# Altium project DC-Motor-Driver-v2.0.PrjPcb (part 2 of 3)

## Sheet Controller_Fuses_Sheet.SchDoc
size 420 x 297 mm; SheetNumber: 5; SheetTotal: 5
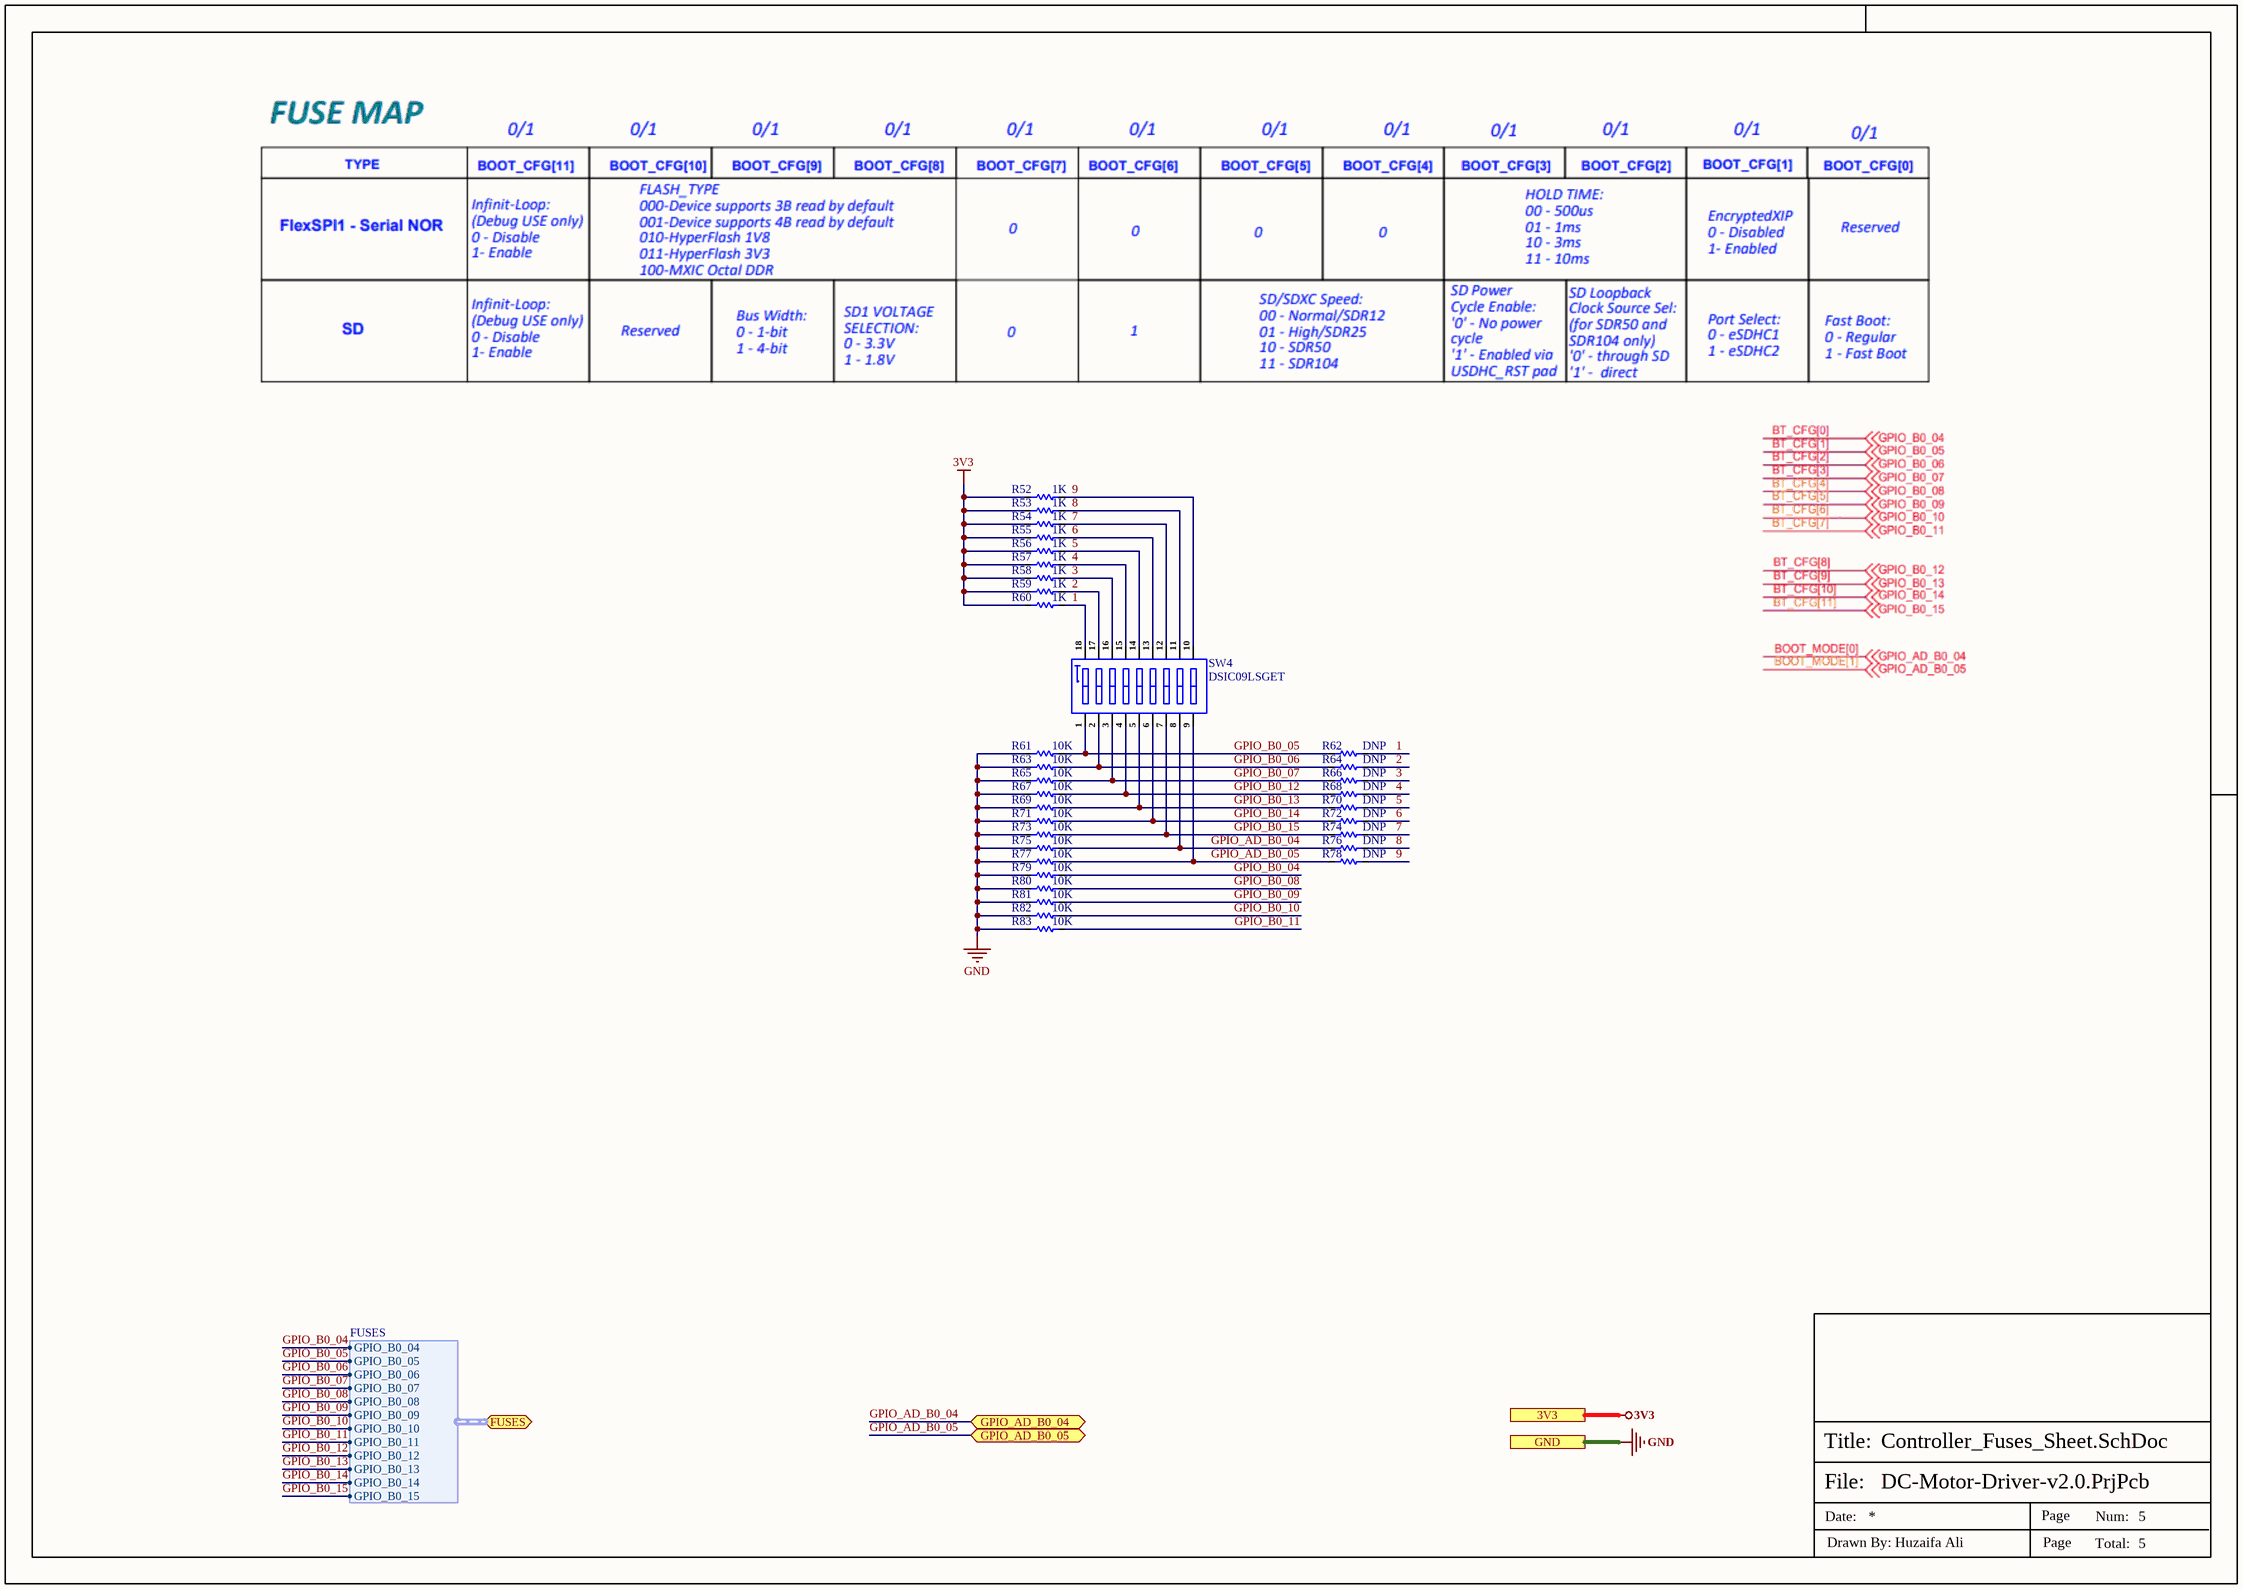
[diagram p2: Controller_Fuses_Sheet.SchDoc]

### Parts
R52  1K  [Res-0603]
R53  1K  [Res-0603]
R54  1K  [Res-0603]
R55  1K  [Res-0603]
R56  1K  [Res-0603]
R57  1K  [Res-0603]
R58  1K  [Res-0603]
R59  1K  [Res-0603]
R60  1K  [Res-0603]
R61  10K  [Res-0402]
R62  DNP  [Res-0402]
R63  10K  [Res-0402]
R64  DNP  [Res-0402]
R65  10K  [Res-0402]
R66  DNP  [Res-0402]
R67  10K  [Res-0402]
R68  DNP  [Res-0402]
R69  10K  [Res-0402]
R70  DNP  [Res-0402]
R71  10K  [Res-0402]
R72  DNP  [Res-0402]
R73  10K  [Res-0402]
R74  DNP  [Res-0402]
R75  10K  [Res-0402]
R76  DNP  [Res-0402]
R77  10K  [Res-0402]
R78  DNP  [Res-0402]
R79  10K  [Res-0402]
R80  10K  [Res-0402]
R81  10K  [Res-0402]
R82  10K  [Res-0402]
R83  10K  [Res-0402]
SW4  DSIC09LSGET  [DSIC09LSGET]

### Ports
3V3, FUSES (bidir, harness FUSES), GND, GPIO_AD_B0_04 (bidir), GPIO_AD_B0_05 (bidir)

### Harnesses
FUSES: GPIO_B0_04, GPIO_B0_05, GPIO_B0_06, GPIO_B0_07, GPIO_B0_08, GPIO_B0_09, GPIO_B0_10, GPIO_B0_11, GPIO_B0_12, GPIO_B0_13, GPIO_B0_14, GPIO_B0_15

### Nets
3V3: R52.2 R53.2 R54.2 R55.2 R56.2 R57.2 R58.2 R59.2 R60.2 ; port 3V3
GND: R61.1 R63.1 R65.1 R67.1 R69.1 R71.1 R73.1 R75.1 R77.1 R79.1 R80.1 R81.1 R82.1 R83.1 ; port GND
1: R60.1 R62.2 SW4.18(B1)
2: R59.1 R64.2 SW4.17(B2)
3: R58.1 R66.2 SW4.16(B3)
4: R57.1 R68.2 SW4.15(B4)
5: R56.1 R70.2 SW4.14(B5)
6: R55.1 R72.2 SW4.13(B6)
7: R54.1 R74.2 SW4.12(B7)
8: R53.1 R76.2 SW4.11(B8)
9: R52.1 R78.2 SW4.10(B9)
GPIO_AD_B0_04: R75.2 R76.1 SW4.8(A8) ; port GPIO_AD_B0_04
GPIO_AD_B0_05: R77.2 R78.1 SW4.9(A9) ; port GPIO_AD_B0_05
GPIO_B0_04: R79.2 ; port FUSES.GPIO_B0_04
GPIO_B0_05: R61.2 R62.1 SW4.1(A1) ; port FUSES.GPIO_B0_05
GPIO_B0_06: R63.2 R64.1 SW4.2(A2) ; port FUSES.GPIO_B0_06
GPIO_B0_07: R65.2 R66.1 SW4.3(A3) ; port FUSES.GPIO_B0_07
GPIO_B0_08: R80.2 ; port FUSES.GPIO_B0_08
GPIO_B0_09: R81.2 ; port FUSES.GPIO_B0_09
GPIO_B0_10: R82.2 ; port FUSES.GPIO_B0_10
GPIO_B0_11: R83.2 ; port FUSES.GPIO_B0_11
GPIO_B0_12: R67.2 R68.1 SW4.4(A4) ; port FUSES.GPIO_B0_12
GPIO_B0_13: R69.2 R70.1 SW4.5(A5) ; port FUSES.GPIO_B0_13
GPIO_B0_14: R71.2 R72.1 SW4.6(A6) ; port FUSES.GPIO_B0_14
GPIO_B0_15: R73.2 R74.1 SW4.7(A7) ; port FUSES.GPIO_B0_15

### Notes on the sheet
- File:
- Title:
- Date:
- Page
- Num:
- Total:
- Drawn By: Huzaifa Ali

### Library data of the parts
R52-R60 = RC0603FR-071KL: RES SMD 1K OHM 1% 1/10W 0603; Manufacturer: Yageo; Resistance: 1kR; Temperature Coefficient: 100ppm/°C; Power Rating: 100mW; Voltage Rating: 50V; Item type: Resistor; ComponentLink1URL: https://www.verical.com/server-webapp/html/getDatasheet?partID=409289&src-supplier=Verical; ComponentLink1Description: https://www.verical.com/server-webapp/html/getDatasheet?partID=409289&src-supplier=Verical; Supplier 1: Digi-Key; Manufacturer Part Number: RC0603FR-071KL; Stock 1: 21472395; Pricing 1: 1=0.1, 10=0.023, 100=0.0094, 1000=0.0042, 2500=0.0037 (USD); Case/Package: 0603; Contact Plating: Tin,Matte; Case Code (Imperial): 0603; Case Code (Metric): 1608; Min Operating Temperature: -55°C; Max Operating Temperature: 155°C; Tolerance: 1%; Composition: Thick Film; Packaging: Tape and Reel; Termination: SMD/SMT; Military Standard: Not; Length: 1.6mm; Height: 0.45mm; Depth: 0.8mm; Radiation Hardening: No; REACH SVHC: No SVHC; Lead Free: Lead Free; ComponentLink2URL: http://documents.rs-components.com/techlib://itc_doclist_GB.htm?stockno=5048928&src-supplier=RSComponents; ComponentLink2Description: http://documents.rs-components.com/techlib://itc_doclist_GB.htm?stockno=5048928&src-supplier=RSComponents; ComponentLink3URL: http://www.yageo.com/documents/recent/PYu-RC0603_51_RoHS_L_4.pdf?src-supplier=Avnet+Europe; ComponentLink3Description: http://www.yageo.com/documents/recent/PYu-RC0603_51_RoHS_L_4.pdf?src-supplier=Avnet+Europe; ComponentLink4URL: http://www.farnell.com/datasheets/2167052.pdf?src-supplier=Element14; ComponentLink4Description: http://www.farnell.com/datasheets/2167052.pdf?src-supplier=Element14; ComponentLink5URL: http://www.farnell.com/datasheets/1868787.pdf?src-supplier=Element14; ComponentLink5Description: http://www.farnell.com/datasheets/1868787.pdf?src-supplier=Element14; ComponentLink6URL: http://www.yageo.com/documents/recent/PYu-RC_Group_51_RoHS_L_2.pdf?src-supplier=Avnet; ComponentLink6Description: http://www.yageo.com/documents/recent/PYu-RC_Group_51_RoHS_L_2.pdf?src-supplier=Avnet; ComponentLink7URL: https://www.verical.com/server-webapp/html/getDatasheet?partID=404327&src-supplier=Verical; ComponentLink7Description: https://www.verical.com/server-webapp/html/getDatasheet?partID=404327&src-supplier=Verical; ComponentLink8URL: http://www.farnell.com/datasheets/443971.pdf?src-supplier=Element14; ComponentLink8Description: http://www.farnell.com/datasheets/443971.pdf?src-supplier=Element14; Supplier Part Number 1: 311-1.00KHRDKR-ND; LCSC Part Number: C22548
R61 R63 R65 R67 R69 R71 R73 R75 R77 R79-R83 = RC0402FR-0710KL: RES 10K OHM 1% 1/16W 0402; Manufacturer: Yageo; Resistance: 10kR; Voltage Rating (DC): 50V; Temperature Coefficient: 100ppm/°C; Power Rating: 62.5mW; Max Power Dissipation: 63mW; Item Type: Resistor; Supplier 1: Mouser; Manufacturer Part Number: RC0402FR-0710KL; RoHS: Yes; Category: Chip SMD Resistors; Stock 1: 18648329; Pricing 1: 1=0.10000, 10=0.01400, 50=0.01400, 100=0.00500, 1000=0.00300, 10000=0.00200 (USD); Case/Package: 0402; Number of Pins: 2; Case Code (Imperial): 0402; Case Code (Metric): 1005; Min Operating Temperature: -55°C; Max Operating Temperature: 155°C; Resistor Type: Thick Film; Tolerance: 1%; Packaging: Tape and Reel; Voltage Rating: 50V; Termination: SMD/SMT; Working Voltage: 50V; Number of Terminations: 2; Features: Moisture Resistant; Series: RC; Resistance Tolerance: 1%; Construction: Rectangular; Length: 1mm; Width: 0.5mm; Height: 0.32mm; Depth: 0.5mm; Lead Pitch: 0.2mm; REACH SVHC: No SVHC; Lead Free: Lead Free; RoHS Compliant: Yes; Military Standard: Not; ComponentLink1URL: https://datasheet.ciiva.com/7660/38568-7660787.pdf?src-supplier=Element14; ComponentLink1Description: https://datasheet.ciiva.com/7660/38568-7660787.pdf?src-supplier=Element14; ComponentLink2URL: https://datasheet.ciiva.com/7849/1686128-7849814.pdf?src-supplier=Element14; ComponentLink2Description: https://datasheet.ciiva.com/7849/1686128-7849814.pdf?src-supplier=Element14; ComponentLink3URL: https://datasheet.ciiva.com/7983/1018594-7983486.pdf?src-supplier=Element14; ComponentLink3Description: https://datasheet.ciiva.com/7983/1018594-7983486.pdf?src-supplier=Element14; ComponentLink4URL: https://datasheet.ciiva.com/22747/1018594-22747512.pdf?src-supplier=Element14; ComponentLink4Description: https://datasheet.ciiva.com/22747/1018594-22747512.pdf?src-supplier=Element14; ComponentLink5URL: https://datasheet.ciiva.com/12667/pyu-rc0402-51-rohs-l-6-r-12667067.pdf?src-supplier=Mouser; ComponentLink5Description: https://datasheet.ciiva.com/12667/pyu-rc0402-51-rohs-l-6-r-12667067.pdf?src-supplier=Mouser; ComponentLink6URL: https://datasheet.ciiva.com/7849/1784430-7849813.pdf?src-supplier=Element14; ComponentLink6Description: https://datasheet.ciiva.com/7849/1784430-7849813.pdf?src-supplier=Element14; ComponentLink7URL: https://datasheet.ciiva.com/7849/1784430-7849815.pdf?src-supplier=Element14; ComponentLink7Description: https://datasheet.ciiva.com/7849/1784430-7849815.pdf?src-supplier=Element14; Supplier Part Number 1: 603-RC0402FR-0710KL; LCSC Part Number: C60490
R62 R64 R66 R68 R70 R72 R74 R76 R78 = RC0402FR-070RL: RES 0 OHM JUMPER 1/16W 0402; Manufacturer: Yageo; Item Type: Resistors; Resistance: 0R; Tolerance: 1%; Power Rating: 62.5mW; Voltage Rating: 50V; Temperature Coefficient: 200ppm/°C; Max Power Dissipation: 63mW; Supplier 1: Mouser; Manufacturer Part Number: RC0402FR-070RL; RoHS: Yes; Stock 1: 8556842; Pricing 1: 1=0.10000, 10=0.01400, 50=0.01400, 100=0.00600, 1000=0.00300, 5000=0.00200, 10000=0.00100 (USD); Mount: Surface Mount; Case/Package: 0402; Contact Plating: Tin,Matte; Case Code (Imperial): 0402; Case Code (Metric): 1005; Size Code: 0402; Min Operating Temperature: -55°C; Max Operating Temperature: 155°C; Resistor Type: Thick Film; Packaging: Tape and Reel; Termination: SMD/SMT; Features: Moisture Resistant; Series: RC; Number of Terminations: 2; Length: 1mm; Width: 0.5mm; Height: 0.35mm; Radiation Hardening: No; Lead Free: Lead Free; RoHS Compliant: Yes; ComponentLink1URL: https://datasheet.ciiva.com/8896/pyu-rc0402-51-rohs-l-6-8896149.pdf?src-supplier=Avnet; ComponentLink1Description: https://datasheet.ciiva.com/8896/pyu-rc0402-51-rohs-l-6-8896149.pdf?src-supplier=Avnet; ComponentLink2URL: https://datasheet.ciiva.com/16790/pyu-rc0402-51-rohs-l-6-r-16790444.pdf?src-supplier=Future+Electronics; ComponentLink2Description: https://datasheet.ciiva.com/16790/pyu-rc0402-51-rohs-l-6-r-16790444.pdf?src-supplier=Future+Electronics; Supplier Part Number 1: 603-RC0402FR-070RL; LCSC Part Number: C106231
SW4 = DSIC09LSGET: 9Bit SPST Black Slide (Standard),凸起式 SMD-18P,6x22.9mm DIP Switches ROHS; Manufacturer: DongGuan; Manufacturer Part Number: DSIC09LSGET; Package: SMD-18P,6x22.9mm; LCSC Part Number: C57455; Item Type: DIP Switche; ComponentLink1Description: LCSC; ComponentLink1URL: https://www.lcsc.com/product-detail/DIP-Switches_DongGuan-KINGTEK-Industrial-Co-LTD-DSIC09LSGET_C57455.html

## Sheet Motor_Section.SchDoc
size 420 x 297 mm; SheetNumber: 4; SheetTotal: 5
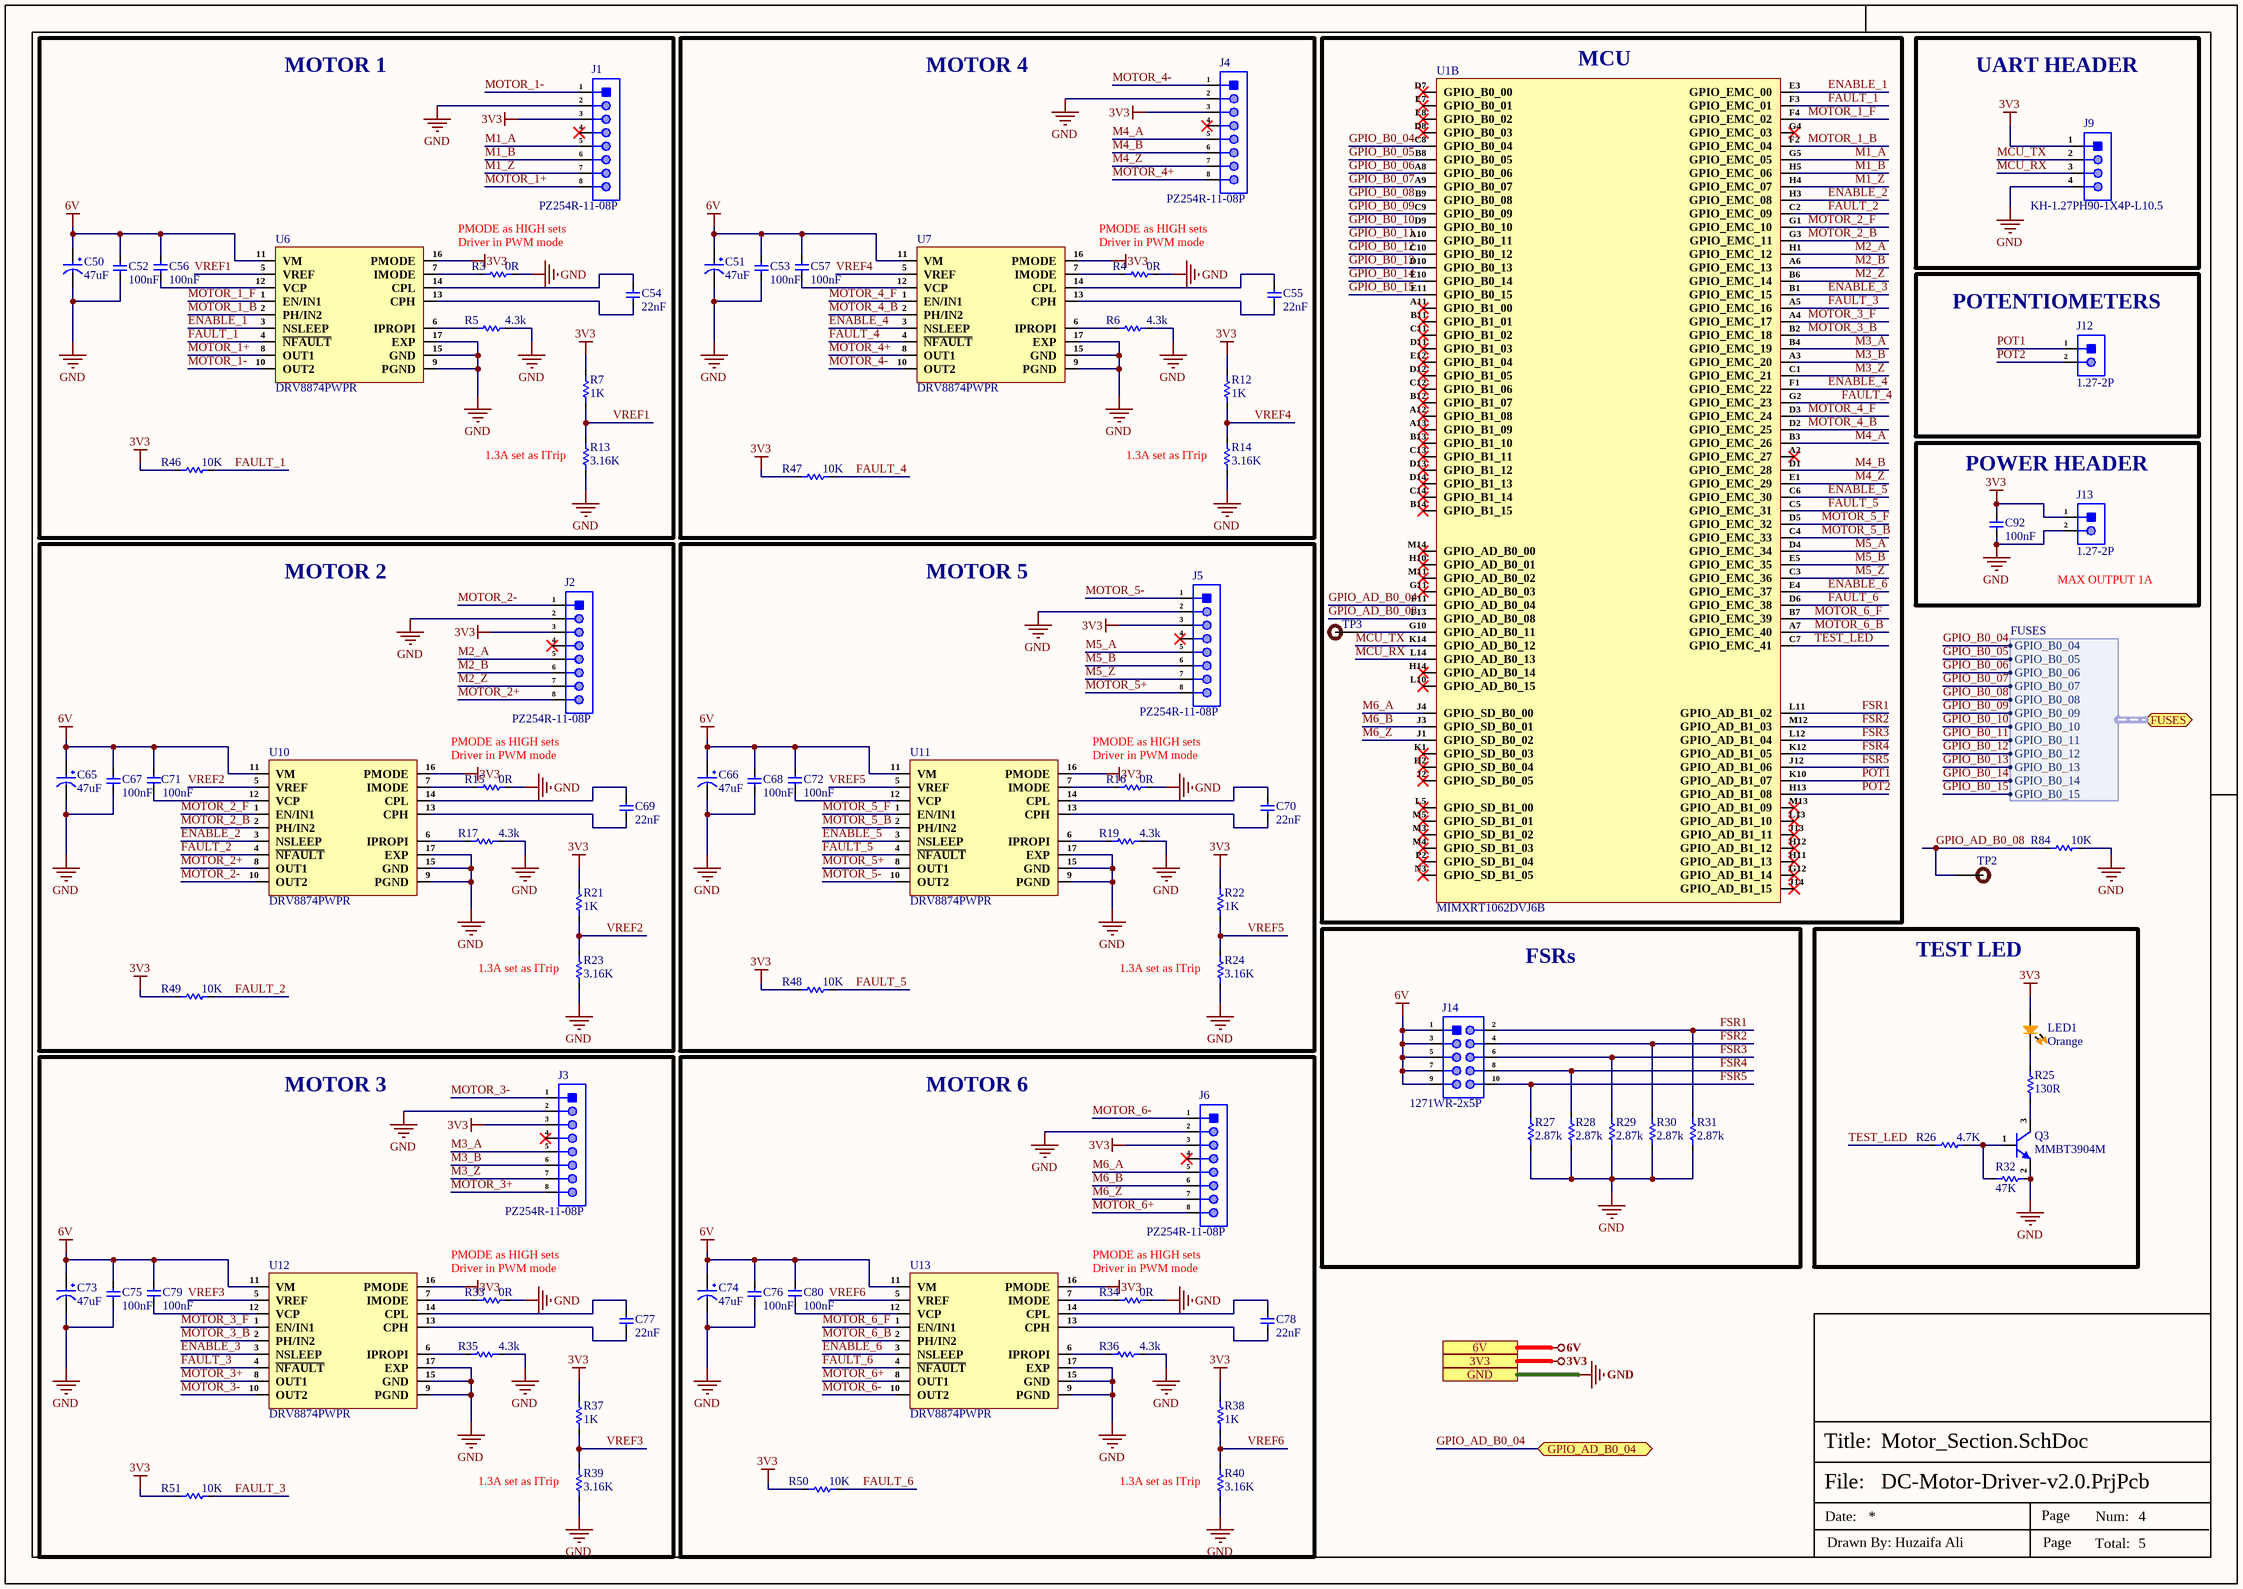
[diagram p3: Motor_Section.SchDoc]

### Parts
C50  47uF  [Tant-1206]
C51  47uF  [Tant-1206]
C52  100nF  [cap-0402]
C53  100nF  [cap-0402]
C54  22nF  [Cap-0402]
C55  22nF  [Cap-0402]
C56  100nF  [cap-0402]
C57  100nF  [cap-0402]
C65  47uF  [Tant-1206]
C66  47uF  [Tant-1206]
C67  100nF  [cap-0402]
C68  100nF  [cap-0402]
C69  22nF  [Cap-0402]
C70  22nF  [Cap-0402]
C71  100nF  [cap-0402]
C72  100nF  [cap-0402]
C73  47uF  [Tant-1206]
C74  47uF  [Tant-1206]
C75  100nF  [cap-0402]
C76  100nF  [cap-0402]
C77  22nF  [Cap-0402]
C78  22nF  [Cap-0402]
C79  100nF  [cap-0402]
C80  100nF  [cap-0402]
C92  100nF  [cap-0402]
J1  PZ254R-11-08P  [HDR 1x8 Male Right Angle]
J2  PZ254R-11-08P  [HDR 1x8 Male Right Angle]
J3  PZ254R-11-08P  [HDR 1x8 Male Right Angle]
J4  PZ254R-11-08P  [HDR 1x8 Male Right Angle]
J5  PZ254R-11-08P  [HDR 1x8 Male Right Angle]
J6  PZ254R-11-08P  [HDR 1x8 Male Right Angle]
J9  KH-1.27PH90-1X4P-L10.5  [HDR1X4 (R/A Male) 1.27mm Pitch]
J12  1.27-2P  [HDR1X2 (R/A Male) 1.27mm Pitch]
J13  1.27-2P  [HDR1X2 (R/A Male) 1.27mm Pitch]
J14  1271WR-2x5P  [HDR 2x5TH (rigth angle) 1.27mm Pitch]
LED1  Orange  [LED-0805]
Q3  MMBT3904M  [SOT-723]
R3  0R  [Res-0402]
R4  0R  [Res-0402]
R5  4.3k  [Res-0402]
R6  4.3k  [Res-0402]
R7  1K  [Res-0402]
R12  1K  [Res-0402]
R13  3.16K  [Res-0603]
R14  3.16K  [Res-0603]
R15  0R  [Res-0402]
R16  0R  [Res-0402]
R17  4.3k  [Res-0402]
R19  4.3k  [Res-0402]
R21  1K  [Res-0402]
R22  1K  [Res-0402]
R23  3.16K  [Res-0603]
R24  3.16K  [Res-0603]
R25  130R  [Res-0603]
R26  4.7K  [Res-0603]
R27  2.87k  [Res-0402]
R28  2.87k  [Res-0402]
R29  2.87k  [Res-0402]
R30  2.87k  [Res-0402]
R31  2.87k  [Res-0402]
R32  47K  [Res-0402]
R33  0R  [Res-0402]
R34  0R  [Res-0402]
R35  4.3k  [Res-0402]
R36  4.3k  [Res-0402]
R37  1K  [Res-0402]
R38  1K  [Res-0402]
R39  3.16K  [Res-0603]
R40  3.16K  [Res-0603]
R46  10K  [Res-0402]
R47  10K  [Res-0402]
R48  10K  [Res-0402]
R49  10K  [Res-0402]
R50  10K  [Res-0402]
R51  10K  [Res-0402]
R84  10K  [Res-0402]
TP2  TEST POINT 0.5mm Dia  [Test-point - 0.5mm]  (value not drawn)  (no BOM)
TP3  TEST POINT 0.5mm Dia  [Test-point - 0.5mm]  (value not drawn)  (no BOM)
U1  MIMXRT1062DVJ6B  [196-LFBGA (12x12)]  (part B of 2)
U6  DRV8874PWPR  [HTSSOP-16]
U7  DRV8874PWPR  [HTSSOP-16]
U10  DRV8874PWPR  [HTSSOP-16]
U11  DRV8874PWPR  [HTSSOP-16]
U12  DRV8874PWPR  [HTSSOP-16]
U13  DRV8874PWPR  [HTSSOP-16]

### Blocks framed on the sheet
MOTOR 1: C50 C52 C54 C56 J1 R3 R5 R7 R13 R46 U6
MOTOR 4: C51 C53 C55 C57 J4 R4 R6 R12 R14 R47 U7
MCU: TP3 U1
UART HEADER: J9
POTENTIOMETERS: J12
POWER HEADER: C92 J13
MOTOR 2: C65 C67 C69 C71 J2 R15 R17 R21 R23 R49 U10
MOTOR 5: C66 C68 C70 C72 J5 R16 R19 R22 R24 R48 U11
FSRs: J14 R27-R31
TEST LED: LED1 Q3 R25 R26 R32
MOTOR 3: C73 C75 C77 C79 J3 R33 R35 R37 R39 R51 U12
MOTOR 6: C74 C76 C78 C80 J6 R34 R36 R38 R40 R50 U13

### Ports
3V3, 6V, FUSES (bidir, harness FUSES), GND, GPIO_AD_B0_04 (bidir)

### Harnesses
FUSES: GPIO_B0_04, GPIO_B0_05, GPIO_B0_06, GPIO_B0_07, GPIO_B0_08, GPIO_B0_09, GPIO_B0_10, GPIO_B0_11, GPIO_B0_12, GPIO_B0_13, GPIO_B0_14, GPIO_B0_15

### Nets
3V3: C92.2 J1.3 J2.3 J3.3 J4.3 J5.3 J6.3 J9.1 J13.1 LED1.1 R7.2 R12.2 R21.2 R22.2 R37.2 R38.2 R46.1 R47.1 R48.1 R49.1 R50.1 R51.1 U6.16(PMODE) U7.16(PMODE) U10.16(PMODE) U11.16(PMODE) U12.16(PMODE) U13.16(PMODE) ; port 3V3
6V: C50.1 C51.1 C52.2 C53.2 C56.1 C57.1 C65.1 C66.1 C67.2 C68.2 C71.1 C72.1 C73.1 C74.1 C75.2 C76.2 C79.1 C80.1 J14.1 J14.3 J14.5 J14.7 J14.9 U6.11(VM) U7.11(VM) U10.11(VM) U11.11(VM) U12.11(VM) U13.11(VM) ; port 6V
GND: C50.2 C51.2 C52.1 C53.1 C65.2 C66.2 C67.1 C68.1 C73.2 C74.2 C75.1 C76.1 C92.1 J1.2 J2.2 J3.2 J4.2 J5.2 J6.2 J9.4 J13.2 Q3.2(E) R3.2 R4.2 R5.2 R6.2 R13.1 R14.1 R15.2 R16.2 R17.2 R19.2 R23.1 R24.1 R27.1 R28.1 R29.1 R30.1 R31.1 R32.2 R33.2 R34.2 R35.2 R36.2 R39.1 R40.1 R84.2 U6.9(PGND) U6.15(GND) U6.17(EXP) U7.9(PGND) U7.15(GND) U7.17(EXP) U10.9(PGND) U10.15(GND) U10.17(EXP) U11.9(PGND) U11.15(GND) U11.17(EXP) U12.9(PGND) U12.15(GND) U12.17(EXP) U13.9(PGND) U13.15(GND) U13.17(EXP) ; port GND
ENABLE_1: U1.E3(GPIO_EMC_00) U6.3(NSLEEP)
ENABLE_2: U1.H3(GPIO_EMC_08) U10.3(NSLEEP)
ENABLE_3: U1.B1(GPIO_EMC_15) U12.3(NSLEEP)
ENABLE_4: U1.F1(GPIO_EMC_22) U7.3(NSLEEP)
ENABLE_5: U1.C6(GPIO_EMC_30) U11.3(NSLEEP)
ENABLE_6: U1.E4(GPIO_EMC_37) U13.3(NSLEEP)
FAULT_1: R46.2 U1.F3(GPIO_EMC_01) U6.4(~{NFAULT})
FAULT_2: R49.2 U1.C2(GPIO_EMC_09) U10.4(~{NFAULT})
FAULT_3: R51.2 U1.A5(GPIO_EMC_16) U12.4(~{NFAULT})
FAULT_4: R47.2 U1.G2(GPIO_EMC_23) U7.4(~{NFAULT})
FAULT_5: R48.2 U1.C5(GPIO_EMC_31) U11.4(~{NFAULT})
FAULT_6: R50.2 U1.D6(GPIO_EMC_38) U13.4(~{NFAULT})
FSR1: J14.2 R31.2 U1.L11(GPIO_AD_B1_02)
FSR2: J14.4 R30.2 U1.M12(GPIO_AD_B1_03)
FSR3: J14.6 R29.2 U1.L12(GPIO_AD_B1_04)
FSR4: J14.8 R28.2 U1.K12(GPIO_AD_B1_05)
FSR5: J14.10 R27.2 U1.J12(GPIO_AD_B1_06)
GPIO_AD_B0_04: U1.F11(GPIO_AD_B0_04) ; port GPIO_AD_B0_04
GPIO_AD_B0_08: R84.1 TP2.1 U1.F13(GPIO_AD_B0_08)
GPIO_B0_04: U1.C8(GPIO_B0_04) ; port FUSES.GPIO_B0_04
GPIO_B0_05: U1.B8(GPIO_B0_05) ; port FUSES.GPIO_B0_05
GPIO_B0_06: U1.A8(GPIO_B0_06) ; port FUSES.GPIO_B0_06
GPIO_B0_07: U1.A9(GPIO_B0_07) ; port FUSES.GPIO_B0_07
GPIO_B0_08: U1.B9(GPIO_B0_08) ; port FUSES.GPIO_B0_08
GPIO_B0_09: U1.C9(GPIO_B0_09) ; port FUSES.GPIO_B0_09
GPIO_B0_10: U1.D9(GPIO_B0_10) ; port FUSES.GPIO_B0_10
GPIO_B0_11: U1.A10(GPIO_B0_11) ; port FUSES.GPIO_B0_11
GPIO_B0_12: U1.C10(GPIO_B0_12) ; port FUSES.GPIO_B0_12
GPIO_B0_13: U1.D10(GPIO_B0_13) ; port FUSES.GPIO_B0_13
GPIO_B0_14: U1.E10(GPIO_B0_14) ; port FUSES.GPIO_B0_14
GPIO_B0_15: U1.E11(GPIO_B0_15) ; port FUSES.GPIO_B0_15
M1_A: J1.5 U1.G5(GPIO_EMC_05)
M1_B: J1.6 U1.H5(GPIO_EMC_06)
M1_Z: J1.7 U1.H4(GPIO_EMC_07)
M2_A: J2.5 U1.H1(GPIO_EMC_12)
M2_B: J2.6 U1.A6(GPIO_EMC_13)
M2_Z: J2.7 U1.B6(GPIO_EMC_14)
M3_A: J3.5 U1.B4(GPIO_EMC_19)
M3_B: J3.6 U1.A3(GPIO_EMC_20)
M3_Z: J3.7 U1.C1(GPIO_EMC_21)
M4_A: J4.5 U1.B3(GPIO_EMC_26)
M4_B: J4.6 U1.D1(GPIO_EMC_28)
M4_Z: J4.7 U1.E1(GPIO_EMC_29)
M5_A: J5.5 U1.D4(GPIO_EMC_34)
M5_B: J5.6 U1.E5(GPIO_EMC_35)
M5_Z: J5.7 U1.C3(GPIO_EMC_36)
M6_A: J6.5 U1.J4(GPIO_SD_B0_00)
M6_B: J6.6 U1.J3(GPIO_SD_B0_01)
M6_Z: J6.7 U1.J1(GPIO_SD_B0_02)
MCU_RX: J9.3 U1.L14(GPIO_AD_B0_13)
MCU_TX: J9.2 U1.K14(GPIO_AD_B0_12)
MOTOR_1+: J1.8 U6.8(OUT1)
MOTOR_1-: J1.1 U6.10(OUT2)
MOTOR_1_B: U1.F2(GPIO_EMC_04) U6.2(PH/IN2)
MOTOR_1_F: U1.F4(GPIO_EMC_02) U6.1(EN/IN1)
MOTOR_2+: J2.8 U10.8(OUT1)
MOTOR_2-: J2.1 U10.10(OUT2)
MOTOR_2_B: U1.G3(GPIO_EMC_11) U10.2(PH/IN2)
MOTOR_2_F: U1.G1(GPIO_EMC_10) U10.1(EN/IN1)
MOTOR_3+: J3.8 U12.8(OUT1)
MOTOR_3-: J3.1 U12.10(OUT2)
MOTOR_3_B: U1.B2(GPIO_EMC_18) U12.2(PH/IN2)
MOTOR_3_F: U1.A4(GPIO_EMC_17) U12.1(EN/IN1)
MOTOR_4+: J4.8 U7.8(OUT1)
MOTOR_4-: J4.1 U7.10(OUT2)
MOTOR_4_B: U1.D2(GPIO_EMC_25) U7.2(PH/IN2)
MOTOR_4_F: U1.D3(GPIO_EMC_24) U7.1(EN/IN1)
MOTOR_5+: J5.8 U11.8(OUT1)
MOTOR_5-: J5.1 U11.10(OUT2)
MOTOR_5_B: U1.C4(GPIO_EMC_33) U11.2(PH/IN2)
MOTOR_5_F: U1.D5(GPIO_EMC_32) U11.1(EN/IN1)
MOTOR_6+: J6.8 U13.8(OUT1)
MOTOR_6-: J6.1 U13.10(OUT2)
MOTOR_6_B: U1.A7(GPIO_EMC_40) U13.2(PH/IN2)
MOTOR_6_F: U1.B7(GPIO_EMC_39) U13.1(EN/IN1)
POT1: J12.1 U1.K10(GPIO_AD_B1_07)
POT2: J12.2 U1.H13(GPIO_AD_B1_08)
TEST_LED: R26.1 U1.C7(GPIO_EMC_41)
VREF1: R7.1 R13.2 U6.5(VREF)
VREF2: R21.1 R23.2 U10.5(VREF)
VREF3: R37.1 R39.2 U12.5(VREF)
VREF4: R12.1 R14.2 U7.5(VREF)
VREF5: R22.1 R24.2 U11.5(VREF)
VREF6: R38.1 R40.2 U13.5(VREF)
NetC54_1: C54.1 U6.13(CPH)
NetC54_2: C54.2 U6.14(CPL)
NetC55_1: C55.1 U7.13(CPH)
NetC55_2: C55.2 U7.14(CPL)
NetC56_2: C56.2 U6.12(VCP)
NetC57_2: C57.2 U7.12(VCP)
NetC69_1: C69.1 U10.13(CPH)
NetC69_2: C69.2 U10.14(CPL)
NetC70_1: C70.1 U11.13(CPH)
NetC70_2: C70.2 U11.14(CPL)
NetC71_2: C71.2 U10.12(VCP)
NetC72_2: C72.2 U11.12(VCP)
NetC77_1: C77.1 U12.13(CPH)
NetC77_2: C77.2 U12.14(CPL)
NetC78_1: C78.1 U13.13(CPH)
NetC78_2: C78.2 U13.14(CPL)
NetC79_2: C79.2 U12.12(VCP)
NetC80_2: C80.2 U13.12(VCP)
NetLED1_2: LED1.2 R25.2
NetQ3_1: Q3.1(B) R26.2 R32.1
NetQ3_3: Q3.3(C) R25.1
NetR3_1: R3.1 U6.7(IMODE)
NetR4_1: R4.1 U7.7(IMODE)
NetR5_1: R5.1 U6.6(IPROPI)
NetR6_1: R6.1 U7.6(IPROPI)
NetR15_1: R15.1 U10.7(IMODE)
NetR16_1: R16.1 U11.7(IMODE)
NetR17_1: R17.1 U10.6(IPROPI)
NetR19_1: R19.1 U11.6(IPROPI)
NetR33_1: R33.1 U12.7(IMODE)
NetR34_1: R34.1 U13.7(IMODE)
NetR35_1: R35.1 U12.6(IPROPI)
NetR36_1: R36.1 U13.6(IPROPI)
NetTP3_1: TP3.1 U1.G10(GPIO_AD_B0_11)

Not connected (* = marked no-connect by the designer): J1 4*; J2 4*; J3 4*; J4 4*; J5 4*; J6 4*; U1 A2(GPIO_EMC_27)* A11(GPIO_B1_00)* A12(GPIO_B1_08)* A13(GPIO_B1_09)* B11(GPIO_B1_01)* B12(GPIO_B1_07)* B13(GPIO_B1_10)* B14(GPIO_B1_15)* C11(GPIO_B1_02)* C12(GPIO_B1_06)* C13(GPIO_B1_11)* C14(GPIO_B1_14)* D7(GPIO_B0_00)* D8(GPIO_B0_03)* D11(GPIO_B1_03)* D12(GPIO_B1_05)* D13(GPIO_B1_12)* D14(GPIO_B1_13)* E7(GPIO_B0_01)* E8(GPIO_B0_02)* E12(GPIO_B1_04)* G4(GPIO_EMC_03)* G11(GPIO_AD_B0_03)* G12(GPIO_AD_B1_14)* H2(GPIO_SD_B0_04)* H10(GPIO_AD_B0_01)* H11(GPIO_AD_B1_13)* H12(GPIO_AD_B1_12)* H14(GPIO_AD_B0_14)* J2(GPIO_SD_B0_05)* J13(GPIO_AD_B1_11)* J14(GPIO_AD_B1_15)* K1(GPIO_SD_B0_03)* L5(GPIO_SD_B1_00)* L10(GPIO_AD_B0_15)* L13(GPIO_AD_B1_10)* M3(GPIO_SD_B1_02)* M4(GPIO_SD_B1_03)* M5(GPIO_SD_B1_01)* M11(GPIO_AD_B0_02)* M13(GPIO_AD_B1_09)* M14(GPIO_AD_B0_00)* N3(GPIO_SD_B1_05)* P2(GPIO_SD_B1_04)*

### Notes on the sheet
- PMODE as HIGH sets Driver in PWM mode
- (near R13) 1.3A set as ITrip
- (near R14) 1.3A set as ITrip
- (near J13) MAX OUTPUT 1A
- (near R23) 1.3A set as ITrip
- (near R24) 1.3A set as ITrip
- (near R39) 1.3A set as ITrip
- (near R40) 1.3A set as ITrip
- File:
- Title:
- Date:
- Page
- Num:
- Total:
- Drawn By: Huzaifa Ali

### Library data of the parts
C50 C51 C65 C66 C73 C74 = TMCMA1A476MTRF: CAP TANT 47UF 20% 10V 1206; Manufacturer: Vishay Sprague; Item Type: Capacitors; ESR (Equivalent Series Resistance): 2.6R; Leakage Current: 9.4uA; Ripple Current: 173mA; Supplier: Mouser; LCSC Part Number: C4984790; Manufacturer Part Number: TMCMA1A476MTRF; RoHS: Yes; Stock: 7380; Pricing: 1=0.44, 10=0.271, 50=0.271, 100=0.175, 1000=0.146, 10000=0.119 (USD); Mounting Technology: Surface Mount; Case/Package: 1206; Case Code (Metric): 3216; Case Code (Imperial): 1206; Weight: 0.000571oz; Min Operating Temperature: -55°C; Max Operating Temperature: 125°C; Packaging: Tape and Reel; Tolerance: 20%; Termination: SMD/SMT; Package Quantity: 2000; Series: TMCM; Voltage Rating: 10V; Dissipation Factor: 20%; Voltage Rating (DC): 10V; Value: 47uF; Length: 3.2mm; Width: 1.6mm; Height: 1.8mm; RoHS Compliant: Yes; Reach SVHC Compliant: Unknown; ComponentLink1URL: http://www.farnell.com/datasheets/1948250.pdf?src-supplier=Farnell; ComponentLink1Description: http://www.farnell.com/datasheets/1948250.pdf?src-supplier=Farnell; ComponentLink2URL: http://www.mouser.com/ds/2/427/tmcm-515668.pdf?src-supplier=Mouser; ComponentLink2Description: http://www.mouser.com/ds/2/427/tmcm-515668.pdf?src-supplier=Mouser; ComponentLink3URL: http://www.farnell.com/datasheets/2245108.pdf?src-supplier=Farnell; ComponentLink3Description: http://www.farnell.com/datasheets/2245108.pdf?src-supplier=Farnell; ComponentLink4URL: http://www.farnell.com/datasheets/1948250.pdf?src-supplier=Element14; ComponentLink4Description: http://www.farnell.com/datasheets/1948250.pdf?src-supplier=Element14; ComponentLink5URL: http://www.vishay.com/docs/40178/tmcm.pdf?src-supplier=Avnet; ComponentLink5Description: http://www.vishay.com/docs/40178/tmcm.pdf?src-supplier=Avnet
C52 C53 C56 C57 C67 C68 C71 C72 C75 C76 C79 C80 C92 = C1005X7R1H104KT000F: CAP CER 0.1UF 50V X7R 0402; Manufacturer: TDK; Tolerance: 10%; Voltage: 25V; Item Type: Capacitor; Supplier 1: Avnet; Manufacturer Part Number: C1005X7R1H104KT000F; RoHS: No; Category: Ceramic Capacitors; Dielectric: X7R; Supplier Part Number 1: C1005X7R1H104KT000F; LCSC Part Number: C361198; ComponentLink1Description: LCSC; ComponentLink1URL: https://www.lcsc.com/product-detail/Multilayer-Ceramic-Capacitors-MLCC-SMD-SMT_TDK-C1005X7R1H104KT000F_C361198.html
C54 C55 C69 C70 C77 C78 = CC0402JRX7R7BB223: CAP CER 0.022UF 16V X7R 0402; Manufacturer: Yageo; Tolerance: 5%; Item Type: Capacitor; Supplier: Digikey; Supplier Part Number: 311-3758-1-ND; Manufacturer Part Number: CC0402JRX7R7BB223; RoHS: Yes; Category: Ceramic Capacitors; Stock: 4203; Pricing: 1=0.1, 10=0.033, 50=0.0192, 100=0.0149, 500=0.0112, 1000=0.0088, 2500=0.008, 5000=0.00736 (USD); Mounting Technology: Surface Mount; Case/Package: 0402; Case Code (Imperial): 0402; Case Code (Metric): 1005; Weight: 2.3E-05oz; Min Operating Temperature: -55°C; Max Operating Temperature: 125°C; Value: 22nF; Packaging: Tape and Reel; Voltage Rating: 16V; Voltage Rating (DC): 16V; Dielectric: X7R; Termination: SMD/SMT; Series: CC; Length: 0.039inch; Width: 0.5mm; Thickness: 0.022inch; RoHS Compliant: Yes; Halogen Free: 5694HalogenFree; Lead Free: 5697LeadFree; ComponentLink1URL: https://datasheet.ciiva.com/13264/upy-gphc-x7r-6-3v-to-50v-8-12304-13264039.pdf?src-supplier=Mouser; ComponentLink1Description: https://datasheet.ciiva.com/13264/upy-gphc-x7r-6-3v-to-50v-8-12304-13264039.pdf?src-supplier=Mouser; LCSC Part Number: C541459
J1-J6 = PZ254R-11-08P: Right-Angle Square Pins 2.5mm 8P 6mm -40℃~+105℃ 2.54mm Plugin Black Brass 1x8P Push-Pull,P=2.54mm Pin Headers ROHS; Manufacturer: XFCN; Manufacturer Part Number: PZ254R-11-08P; Footprint: Custom; ComponentLink1Description: LCSC; ComponentLink1URL: https://www.lcsc.com/product-detail/Pin-Headers_XFCN-PZ254R-11-08P_C492416.html; LCSC Part Number: C492416
J9 = KH-1.27PH90-1X4P-L10.5: 1A Right-Angle Square Pins 1mm 4P 4mm -40℃~+105℃ 1.27mm Plugin 1x4P Push-Pull,P=1.27mm Pin Headers ROHS; Manufacturer: Shenzhen Kinghelm Elec; Item Type: Header; Supplier: LCSC; LCSC Part Number: C2938416; Manufacturer Part Number: KH-1.27PH90-1X4P-L10.5; RoHS: No
J12 J13 = 1.27-2P: 250V 1A Right-Angle Square Pins 2P -25℃~+85℃ 1.27mm Plugin Black 1x2P Push-Pull,P=1.27mm Pin Headers ROHS; Manufacturer: BOOMELE; Manufacturer Part Number: 1.27-2P; Package: Push-Pull,P=1.27mm; LCSC Part Number: C48999; Item Type: Headers; ComponentLink1Description: LCSC; ComponentLink1URL: https://jlcpcb.com/partdetail/boomele_boom_Precision_elec-1_272P/C48999
J14 = 1271WR-2x5P: Gold Right-Angle Square Pins 2mm 3mm 10P -40℃~+105℃ 1.27mm Double row 2x5P Push-Pull,P=1.27mm Pin Headers ROHS; Manufacturer: HanElectricity; Item Type: Header; Manufacturer Part Number: 1271WR-2x5P; Package: Push-Pull,P=1.27mm; LCSC Part Number: C7470108; ComponentLink1Description: LCSC; ComponentLink1URL: https://jlcpcb.com/partdetail/Hanelectricity-1271WR2x5P/C7470108
LED1 = XL-2012UOC: Colorless transparence -30℃~+85℃ 601nm~603nm Positive post Orange 120° 55mW 0805 Light Emitting Diodes (LED) ROHS; Manufacturer: XINGLIGHT; Manufacture Part No: XL-2012UOC; Package: 0805; LCSC Part no: C965813
Q3 = MMBT3904M: 40V 100mW 100@10mA,1V 200mA 300MHz 300mV@50mA,5mA NPN -55℃~+150℃@(Tj) SOT-723 Bipolar Transistors - BJT ROHS; Manufacturer: TECH PUBLIC; Item Type: Mosfet; ComponentLink1Description: LCSC; ComponentLink1URL: https://www.lcsc.com/product-detail/Bipolar-Transistors-BJT_TECH-PUBLIC-MMBT3904M_C2923360.html; Manufacturer Part Number: MMBT3904M; Package: SOT-723; LCSC Part Number: C2923360
R3 R4 R15 R16 R33 R34 = RC0402FR-070RL: RES 0 OHM JUMPER 1/16W 0402; Manufacturer: Yageo; Item Type: Resistors; Tolerance: 1%; Power Rating: 62.5mW; Voltage Rating: 50V; Temperature Coefficient: 200ppm/°C; Max Power Dissipation: 63mW; Supplier 1: Mouser; Manufacturer Part Number: RC0402FR-070RL; RoHS: Yes; Stock 1: 8556842; Pricing 1: 1=0.10000, 10=0.01400, 50=0.01400, 100=0.00600, 1000=0.00300, 5000=0.00200, 10000=0.00100 (USD); Mount: Surface Mount; Case/Package: 0402; Contact Plating: Tin,Matte; Case Code (Imperial): 0402; Case Code (Metric): 1005; Size Code: 0402; Min Operating Temperature: -55°C; Max Operating Temperature: 155°C; Resistance: 0R; Resistor Type: Thick Film; Packaging: Tape and Reel; Termination: SMD/SMT; Features: Moisture Resistant; Series: RC; Number of Terminations: 2; Length: 1mm; Width: 0.5mm; Height: 0.35mm; Radiation Hardening: No; Lead Free: Lead Free; RoHS Compliant: Yes; ComponentLink1URL: https://datasheet.ciiva.com/8896/pyu-rc0402-51-rohs-l-6-8896149.pdf?src-supplier=Avnet; ComponentLink1Description: https://datasheet.ciiva.com/8896/pyu-rc0402-51-rohs-l-6-8896149.pdf?src-supplier=Avnet; ComponentLink2URL: https://datasheet.ciiva.com/16790/pyu-rc0402-51-rohs-l-6-r-16790444.pdf?src-supplier=Future+Electronics; ComponentLink2Description: https://datasheet.ciiva.com/16790/pyu-rc0402-51-rohs-l-6-r-16790444.pdf?src-supplier=Future+Electronics; Supplier Part Number 1: 603-RC0402FR-070RL; LCSC Part Number: C106231
R5 R6 R17 R19 R35 R36 = 0402WGF4301TCE: 62.5mW Thick Film Resistors 50V ±100ppm/℃ ±1% 4.3kΩ 0402 Chip Resistor - Surface Mount ROHS; Manufacturer: Royal Electronic Factory; Value: 4.3kR; Temperature Coefficient: 100ppm/°C; Supplier: Mouser; Supplier Part Number: 303-0402WGF4301TCE; Manufacturer Part Number: 0402WGF4301TCE; RoHS: No; Item Type: Resistor; Pricing: 10000=0.004 (USD); ComponentLink1URL: http://datasheet.octopart.com/0402WGF4301TCE-Royal-Ohm-datasheet-17591902.pdf?src-supplier=Mouser; ComponentLink1Description: http://datasheet.octopart.com/0402WGF4301TCE-Royal-Ohm-datasheet-17591902.pdf?src-supplier=Mouser; ComponentLink2URL: https://datasheet.octopart.com/0402WGF4301TCE-Royal-Ohm-datasheet-165785611.pdf?src-supplier=TME; ComponentLink2Description: https://datasheet.octopart.com/0402WGF4301TCE-Royal-Ohm-datasheet-165785611.pdf?src-supplier=TME; LCSC Part Number: C25899
R7 R12 R21 R22 R37 R38 = CRCW04021K00FKEDHP: RES SMD 1K OHM 1% 1/5W 0402; Manufacturer: Vishay Dale; Resistance: 1kR; Temperature Coefficient: 100ppm/°C; Power Rating: 125mW; Voltage Rating: 50V; Supplier 1: Digi-Key; Manufacturer Part Number: CRCW04021K00FKEDHP; Stock 1: 315989; Pricing 1: 1=0.15, 10=0.132, 100=0.0506, 1000=0.02226, 2500=0.01923, 5000=0.0172 (USD); Mount: Surface Mount; Case/Package: 0402; Number of Pins: 2; Contact Plating: Tin; Weight: 2.3E-05oz; Case Code (Imperial): 0402; Case Code (Metric): 1005; Size Code: 0402; Min Operating Temperature: -55°C; Max Operating Temperature: 155°C; Tolerance: 1%; Resistor Type: Thick Film; Package Quantity: 10; Packaging: Tape and Reel; Number of Terminations: 2; Termination: SMD/SMT; Max Power Dissipation: 125mW; Voltage Rating (DC): 50V; Features: Automotive AEC-Q200; Series: CRCW-HP; Construction: Rectangular; Technology: THICK FILM; Resistance Tolerance: 1%; Length: 1mm; Width: 0.5mm; Height: 0.3mm; Depth: 0.5mm; Radiation Hardening: No; REACH SVHC: Unknown; Military Standard: Not; Lead Free: Lead Free; RoHS Compliant: Yes; ComponentLink1URL: http://www.farnell.com/datasheets/2339608.pdf?src-supplier=Element14; ComponentLink1Description: http://www.farnell.com/datasheets/2339608.pdf?src-supplier=Element14; ComponentLink2URL: http://www.vishay.com/docs/20043/crcwhpe3.pdf?src-supplier=Digi-Key; ComponentLink2Description: http://www.vishay.com/docs/20043/crcwhpe3.pdf?src-supplier=Digi-Key; ComponentLink3URL: http://www.mouser.com/ds/2/427/crcwhpe3-46056.pdf?src-supplier=Mouser; ComponentLink3Description: http://www.mouser.com/ds/2/427/crcwhpe3-46056.pdf?src-supplier=Mouser; ComponentLink4URL: http://www.vishay.com/docs/20043/crcwhpe3.pdf?src-supplier=Avnet; ComponentLink4Description: http://www.vishay.com/docs/20043/crcwhpe3.pdf?src-supplier=Avnet; ComponentLink5URL: http://www.vishay.com/docs/20043/crcwhpe3.pdf?src-supplier=Future+Electronics; ComponentLink5Description: http://www.vishay.com/docs/20043/crcwhpe3.pdf?src-supplier=Future+Electronics; Supplier Part Number 1: 541-1.00KYCT-ND; LCSC Part Number: C313354
R13 R14 R23 R24 R39 R40 = RT0603BRD073K16L: RES SMD 3.16KOHM 0.1% 1/10W 0603; Manufacturer: Yageo; Voltage Rating: 75V; Resistance: 3.16kR; Power Rating: 100mW; Temperature Coefficient: 25ppm/°C; Voltage Rating (DC): 50V; Item Type: Resistor; Supplier 1: Arrow Electronics; Manufacturer Part Number: RT0603BRD073K16L; RoHS: Yes; Category: Chip SMD Resistors; Stock 1: 4487; Pricing 1: 1=0.31330, 10=0.25380, 25=0.25120, 100=0.09580, 250=0.09480, 500=0.09380, 1000=0.05630, 3000=0.03310 (USD); Case/Package: 0603; Case Code (Metric): 1608; Case Code (Imperial): 0603; Min Operating Temperature: -55°C; Max Operating Temperature: 125°C; Tolerance: 0.1%; Packaging: Tape and Reel; Package Quantity: 5000; Termination: SMD/SMT; Resistor Type: Thin Film; Number of Terminations: 2; Max Power Dissipation: 100mW; Series: RT; Construction: Rectangular; Length: 0.063inch; Width: 0.031inch; Height: 0.022inch; Depth: 0.8mm; Military Standard: Not; Lead Free: Lead Free; RoHS Compliant: Yes; ComponentLink1URL: https://datasheet.ciiva.com/2585/pyu-rt-1-to-0-05-rohs-l-5-2585923.pdf?src-supplier=Digi-Key; ComponentLink1Description: https://datasheet.ciiva.com/2585/pyu-rt-1-to-0-05-rohs-l-5-2585923.pdf?src-supplier=Digi-Key; Supplier Part Number 1: RT0603BRD073K16L; LCSC Part Number: C861373
R25 = RC0603FR-07130RL: RES 130 OHM 1% 1/10W 0603; Manufacturer: Yageo; Power Rating: 100mW; Temperature Coefficient: 100ppm/°C; Voltage Rating (DC): 50V; Voltage Rating: 75V; Item Type: Resistor; Supplier 1: Future Electronics; Manufacturer Part Number: RC0603FR-07130RL; RoHS: Yes; Category: Chip SMD Resistors; Stock 1: 630000; Pricing 1: 5000=0.0014, 75000=0.0013, 200000=0.0013, 750000=0.0012, 2000000=0.0011 (USD); Case/Package: 0603; Pins: 2; Case Code (Imperial): 0603; Case Code (Metric): 1608; Weight: 7.1E-05oz; Min Operating Temperature: -55°C; Max Operating Temperature: 155°C; Value: 130R; Tolerance: 1%; Packaging: Tape and Reel; Resistor Type: Thick Film; Termination: SMD/SMT; Number of Terminations: 2; Max Power Dissipation: 100mW; Features: Moisture Resistant; Series: RC; Resistance Tolerance: 1%; Construction: Rectangular; Length: 1.6mm; Width: 0.8mm; Height: 0.45mm; Depth: 0.8mm; Lead Free: Lead Free; Reach SVHC Compliant: No; Military Standard: Not; RoHS Compliant: Yes; ComponentLink1URL: https://datasheet.ciiva.com/46395/443971-46395023.pdf?src-supplier=Element14; ComponentLink1Description: https://datasheet.ciiva.com/46395/443971-46395023.pdf?src-supplier=Element14; ComponentLink2URL: https://datasheet.ciiva.com/2553/pyu-r-int-thick-7-2553516.pdf?src-supplier=Digi-Key; ComponentLink2Description: https://datasheet.ciiva.com/2553/pyu-r-int-thick-7-2553516.pdf?src-supplier=Digi-Key; ComponentLink3URL: https://datasheet.ciiva.com/2553/pyu-r-int-thick-7-2553517.pdf?src-supplier=Digi-Key; ComponentLink3Description: https://datasheet.ciiva.com/2553/pyu-r-int-thick-7-2553517.pdf?src-supplier=Digi-Key; ComponentLink4URL: https://datasheet.ciiva.com/2553/pyu-r-int-thick-7-2553515.pdf?src-supplier=Digi-Key; ComponentLink4Description: https://datasheet.ciiva.com/2553/pyu-r-int-thick-7-2553515.pdf?src-supplier=Digi-Key; Supplier Part Number 1: 1846773; LCSC Part Number: C141677
R26 = RC0603JR-074K7L: RES SMD 4.7K OHM 5% 1/10W 0603; Manufacturer: Yageo; Resistance: 4.7kR; Temperature Coefficient: 100ppm/°C; Voltage Rating (DC): 50V; Power Rating: 100mW; Item Type: Resistor; Supplier 1: Digi-Key; Manufacturer Part Number: RC0603JR-074K7L; Stock 1: 19706643; Pricing 1: 1=0.1, 10=0.02, 100=0.0081, 1000=0.00362, 2500=0.00314 (USD); Case/Package: 0603; Number of Pins: 2; Case Code (Imperial): 0603; Case Code (Metric): 1608; Min Operating Temperature: -55°C; Max Operating Temperature: 155°C; Tolerance: 5%; Composition: Thick Film; Packaging: Tape and Reel; Voltage Rating: 50V; Termination: SMD/SMT; Military Standard: Not; Length: 1.6mm; Width: 0.8mm; Depth: 0.8mm; REACH SVHC: No SVHC; Lead Free: Lead Free; ComponentLink1URL: http://www.farnell.com/datasheets/443971.pdf?src-supplier=Element14; ComponentLink1Description: http://www.farnell.com/datasheets/443971.pdf?src-supplier=Element14; Supplier Part Number 1: 311-4.7KGRCT-ND; LCSC Part Number: C105428
R27-R31 = RT0402BRD072K87L: RES SMD 2.87KOHM 0.1% 1/16W 0402; Manufacturer: Yageo; Item Type: Resistor; Supplier 1: Future Electronics; Manufacturer Part Number: RT0402BRD072K87L; RoHS: Yes; Category: Chip SMD Resistors; Stock 1: 10000; Pricing 1: 10000=0.0185, 20000=0.0181, 40000=0.0177, 50000=0.0176, 150000=0.0168 (USD); ComponentLink1URL: https://datasheet.ciiva.com/2582/pyu-rt-1-to-0-05-rohs-l-5-2582296.pdf?src-supplier=Digi-Key; ComponentLink1Description: https://datasheet.ciiva.com/2582/pyu-rt-1-to-0-05-rohs-l-5-2582296.pdf?src-supplier=Digi-Key; LCSC Part Number: C852707; Supplier Part Number 1: 2128457
R32 = RC0402FR-0747KL: RES 47K OHM 1% 1/16W 0402; Manufacturer: Yageo; Power Rating: 62.5mW; Temperature Coefficient: 100ppm/°C; Voltage Rating: 50V; Resistance: 47kR; Max Power Dissipation: 63mW; Item Type: Resistor; Supplier 1: Avnet; Manufacturer Part Number: RC0402FR-0747KL; RoHS: Yes; Category: Chip SMD Resistors; Stock 1: 680000; Pricing 1: 10000=0.00085, 20000=0.00087, 40000=0.00084, 60000=0.00083, 80000=0.00079, 100000=0.00078, 1000000=0.00076 (USD); Case/Package: 0402; Case Code (Imperial): 0402; Case Code (Metric): 1005; Size Code: 0402; Min Operating Temperature: -55°C; Max Operating Temperature: 155°C; Tolerance: 1%; Series: RC; Packaging: Tape and Reel; Package Quantity: 1; Termination: SMD/SMT; Resistor Type: Thick Film; Number of Terminations: 2; Features: Moisture Resistant; Resistance Tolerance: 1%; Construction: Rectangular; Length: 1mm; Width: 0.02inch; Height: 0.016inch; Depth: 0.5mm; RoHS Compliant: Yes; Military Standard: Not; Lead Free: Lead Free; ComponentLink1URL: https://datasheet.ciiva.com/46412/1018594-46412839.pdf?src-supplier=Element14; ComponentLink1Description: https://datasheet.ciiva.com/46412/1018594-46412839.pdf?src-supplier=Element14; ComponentLink2URL: https://datasheet.ciiva.com/2453/pyu-r-int-thick-7-2453389.pdf?src-supplier=Digi-Key; ComponentLink2Description: https://datasheet.ciiva.com/2453/pyu-r-int-thick-7-2453389.pdf?src-supplier=Digi-Key; ComponentLink3URL: https://datasheet.ciiva.com/2453/pyu-r-int-thick-7-2453390.pdf?src-supplier=Digi-Key; ComponentLink3Description: https://datasheet.ciiva.com/2453/pyu-r-int-thick-7-2453390.pdf?src-supplier=Digi-Key; ComponentLink4URL: https://datasheet.ciiva.com/2453/pyu-r-int-thick-7-2453388.pdf?src-supplier=Digi-Key; ComponentLink4Description: https://datasheet.ciiva.com/2453/pyu-r-int-thick-7-2453388.pdf?src-supplier=Digi-Key; ComponentLink5URL: https://datasheet.ciiva.com/15189/getdatasheetpartid-323748-15189466.pdf?src-supplier=Verical; ComponentLink5Description: https://datasheet.ciiva.com/15189/getdatasheetpartid-323748-15189466.pdf?src-supplier=Verical; ComponentLink6URL: https://datasheet.ciiva.com/16793/pyu-rc0402-51-rohs-l-6-r-16793430.pdf?src-supplier=Future+Electronics; ComponentLink6Description: https://datasheet.ciiva.com/16793/pyu-rc0402-51-rohs-l-6-r-16793430.pdf?src-supplier=Future+Electronics; Supplier Part Number 1: RC0402FR-0747KL; LCSC Part Number: C93943
R46-R51 R84 = RC0402FR-0710KL: as R61 on sheet Controller_Fuses_Sheet; Supplier 1: Mouser; Manufacturer Part Number: RC0402FR-0710KL; RoHS: Yes; Category: Chip SMD Resistors; Stock 1: 18648329; Pricing 1: 1=0.10000, 10=0.01400, 50=0.01400, 100=0.00500, 1000=0.00300, 10000=0.00200 (USD); Case/Package: 0402; Number of Pins: 2; Case Code (Imperial): 0402; Case Code (Metric): 1005; Min Operating Temperature: -55°C; Max Operating Temperature: 155°C; Resistor Type: Thick Film; Tolerance: 1%; Packaging: Tape and Reel; Voltage Rating: 50V; Termination: SMD/SMT; Working Voltage: 50V; Number of Terminations: 2; Features: Moisture Resistant; Series: RC; Resistance Tolerance: 1%; Construction: Rectangular; Length: 1mm; Width: 0.5mm; Height: 0.32mm; Depth: 0.5mm; Lead Pitch: 0.2mm; REACH SVHC: No SVHC; Lead Free: Lead Free; RoHS Compliant: Yes; Military Standard: Not; ComponentLink1URL: https://datasheet.ciiva.com/7660/38568-7660787.pdf?src-supplier=Element14; ComponentLink1Description: https://datasheet.ciiva.com/7660/38568-7660787.pdf?src-supplier=Element14; ComponentLink2URL: https://datasheet.ciiva.com/7849/1686128-7849814.pdf?src-supplier=Element14; ComponentLink2Description: https://datasheet.ciiva.com/7849/1686128-7849814.pdf?src-supplier=Element14; ComponentLink3URL: https://datasheet.ciiva.com/7983/1018594-7983486.pdf?src-supplier=Element14; ComponentLink3Description: https://datasheet.ciiva.com/7983/1018594-7983486.pdf?src-supplier=Element14; ComponentLink4URL: https://datasheet.ciiva.com/22747/1018594-22747512.pdf?src-supplier=Element14; ComponentLink4Description: https://datasheet.ciiva.com/22747/1018594-22747512.pdf?src-supplier=Element14; ComponentLink5URL: https://datasheet.ciiva.com/12667/pyu-rc0402-51-rohs-l-6-r-12667067.pdf?src-supplier=Mouser; ComponentLink5Description: https://datasheet.ciiva.com/12667/pyu-rc0402-51-rohs-l-6-r-12667067.pdf?src-supplier=Mouser; ComponentLink6URL: https://datasheet.ciiva.com/7849/1784430-7849813.pdf?src-supplier=Element14; ComponentLink6Description: https://datasheet.ciiva.com/7849/1784430-7849813.pdf?src-supplier=Element14; ComponentLink7URL: https://datasheet.ciiva.com/7849/1784430-7849815.pdf?src-supplier=Element14; ComponentLink7Description: https://datasheet.ciiva.com/7849/1784430-7849815.pdf?src-supplier=Element14; Supplier Part Number 1: 603-RC0402FR-0710KL; LCSC Part Number: C60490
TP2 TP3 = TEST POINT 0.5mm Dia: Test Point ON; Item Type: Test Point; Manufacturer Part Number: TEST POINT 0.5mm Dia
U1 = MIMXRT1062DVJ6B: IC MCU 32BIT EXT MEM 196LFBGA; Manufacturer: NXP Semiconductors; Supplier: Digi-Key; Supplier Part Number: 568-MIMXRT1062DVJ6B-ND; Manufacturer Part Number: MIMXRT1062DVJ6B; RoHS: Yes; Category: Uncategorized; Stock: 1142; Pricing: 1=15.93, 10=12.734, 189=10.75497, 567=10.68896, 945=10.09187 (USD)
U6 U7 U10-U13 = DRV8874PWPR: DRV8874 H-BRIDGE MOTOR DRIVER; Manufacturer: Texas Instruments; Item Type: IC; Supplier: Mouser; Supplier Part Number: 595-DRV8874PWPR; Manufacturer Part Number: DRV8874PWPR; RoHS: Yes; Stock: 13429; Pricing: 1=2.68, 10=2.4, 50=2.4, 100=1.93, 1000=1.31, 10000=1.22 (USD); Length: 5mm; Width: 4.4mm; Height: 1.2mm; Thickness: 1mm; ComponentLink1URL: http://www.ti.com/general/docs/suppproductinfo.tsp?distId=10&amp;gotoUrl=http%3A%2F%2Fwww.ti.com%2Flit%2Fgpn%2Fdrv8874&src-supplier=Digikey; ComponentLink1Description: http://www.ti.com/general/docs/suppproductinfo.tsp?distId=10&amp;gotoUrl=http%3A%2F%2Fwww.ti.com%2Flit%2Fgpn%2Fdrv8874&src-supplier=Digikey; LCSC Part Number: C1855818